# Altium schematic sheet Top-Sheet.SchDoc
size A4; SheetNumber: 1; SheetTotal: 11
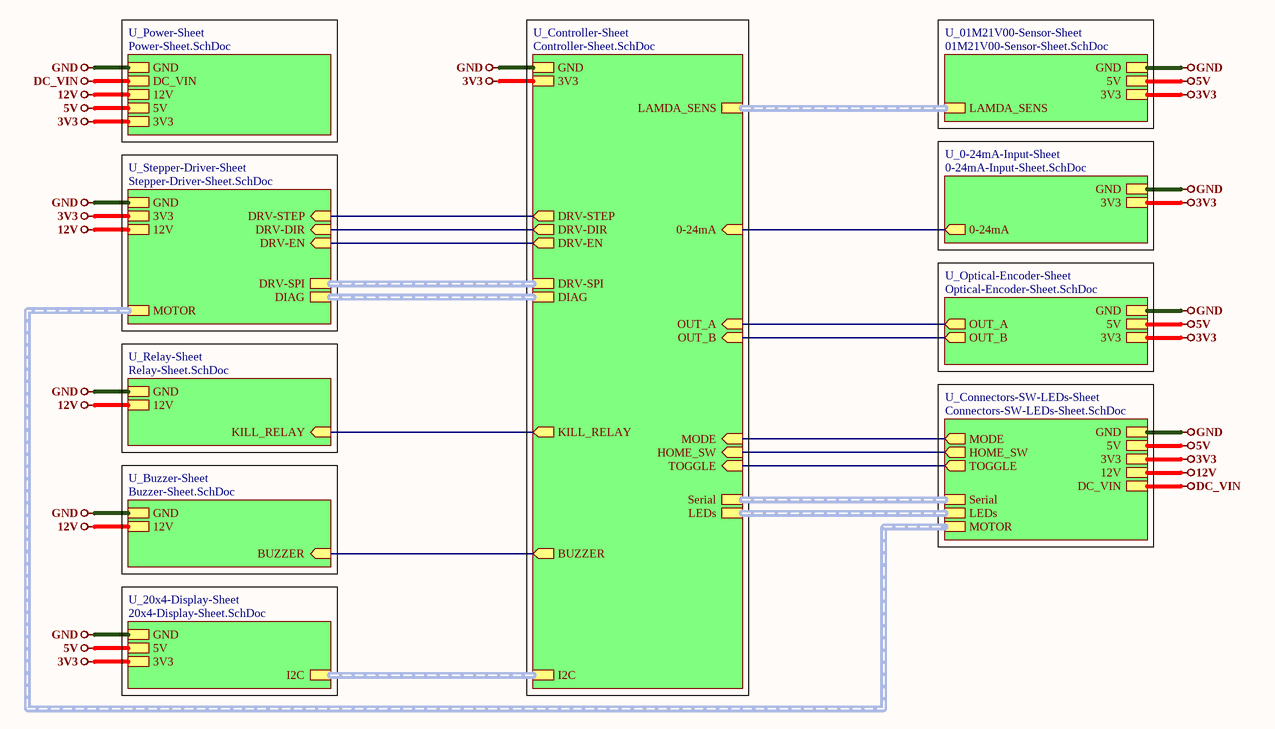
[diagram p0: Top-Sheet.SchDoc]

## Sub-sheets
U_0-24mA-Input-Sheet = 0-24mA-Input-Sheet.SchDoc: GND, 3V3, 0-24mA (out)
U_01M21V00-Sensor-Sheet = 01M21V00-Sensor-Sheet.SchDoc: GND, 5V, 3V3, LAMDA_SENS (harness LAMDA_SENS)
U_20x4-Display-Sheet = 20x4-Display-Sheet.SchDoc: GND, 5V, 3V3, I2C (harness I2C)
U_Buzzer-Sheet = Buzzer-Sheet.SchDoc: GND, 12V, BUZZER (in)
U_Connectors-SW-LEDs-Sheet = Connectors-SW-LEDs-Sheet.SchDoc: GND, 5V, 3V3, DC_VIN, Serial (harness Serial), MODE (out), HOME_SW (out), TOGGLE (out), MOTOR (harness MOTOR), 12V, LEDs (harness LEDs)
U_Controller-Sheet = Controller-Sheet.SchDoc: GND, 3V3, DRV-SPI (harness DRV-SPI), DIAG (harness DIAG), DRV-STEP (out), DRV-DIR (out), DRV-EN (out), KILL_RELAY (out), BUZZER (out), I2C (harness I2C), LAMDA_SENS (harness LAMDA_SENS), 0-24mA (in), OUT_A (in), OUT_B (in), Serial (harness Serial), MODE (in), HOME_SW (in), TOGGLE (in), LEDs (harness LEDs)
U_Optical-Encoder-Sheet = Optical-Encoder-Sheet.SchDoc: GND, 5V, 3V3, OUT_A (out), OUT_B (out)
U_Power-Sheet = Power-Sheet.SchDoc: GND, DC_VIN, 12V, 5V, 3V3
U_Relay-Sheet = Relay-Sheet.SchDoc: GND, 12V, KILL_RELAY (in)
U_Stepper-Driver-Sheet = Stepper-Driver-Sheet.SchDoc: GND, 3V3, 12V, MOTOR (harness MOTOR), DRV-SPI (harness DRV-SPI), DIAG (harness DIAG), DRV-STEP (in), DRV-DIR (in), DRV-EN (in)

## Nets
3V3: sheet U_Power-Sheet/3V3, sheet U_Controller-Sheet/3V3, sheet U_Stepper-Driver-Sheet/3V3, sheet U_20x4-Display-Sheet/3V3, sheet U_01M21V00-Sensor-Sheet/3V3, sheet U_0-24mA-Input-Sheet/3V3, sheet U_Optical-Encoder-Sheet/3V3, sheet U_Connectors-SW-LEDs-Sheet/3V3
5V: sheet U_Power-Sheet/5V, sheet U_20x4-Display-Sheet/5V, sheet U_01M21V00-Sensor-Sheet/5V, sheet U_Optical-Encoder-Sheet/5V, sheet U_Connectors-SW-LEDs-Sheet/5V
12V: sheet U_Power-Sheet/12V, sheet U_Stepper-Driver-Sheet/12V, sheet U_Relay-Sheet/12V, sheet U_Buzzer-Sheet/12V, sheet U_Connectors-SW-LEDs-Sheet/12V
DC_VIN: sheet U_Power-Sheet/DC_VIN, sheet U_Connectors-SW-LEDs-Sheet/DC_VIN
GND: sheet U_Power-Sheet/GND, sheet U_Controller-Sheet/GND, sheet U_Stepper-Driver-Sheet/GND, sheet U_Relay-Sheet/GND, sheet U_Buzzer-Sheet/GND, sheet U_20x4-Display-Sheet/GND, sheet U_01M21V00-Sensor-Sheet/GND, sheet U_0-24mA-Input-Sheet/GND, sheet U_Optical-Encoder-Sheet/GND, sheet U_Connectors-SW-LEDs-Sheet/GND
(unnamed): sheet U_Controller-Sheet/DRV-STEP, sheet U_Stepper-Driver-Sheet/DRV-STEP
(unnamed): sheet U_Controller-Sheet/DRV-DIR, sheet U_Stepper-Driver-Sheet/DRV-DIR
(unnamed): sheet U_Controller-Sheet/DRV-EN, sheet U_Stepper-Driver-Sheet/DRV-EN
(unnamed): sheet U_Controller-Sheet/KILL_RELAY, sheet U_Relay-Sheet/KILL_RELAY
(unnamed): sheet U_Controller-Sheet/BUZZER, sheet U_Buzzer-Sheet/BUZZER
(unnamed): sheet U_Controller-Sheet/0-24mA, sheet U_0-24mA-Input-Sheet/0-24mA
(unnamed): sheet U_Controller-Sheet/OUT_A, sheet U_Optical-Encoder-Sheet/OUT_A
(unnamed): sheet U_Controller-Sheet/OUT_B, sheet U_Optical-Encoder-Sheet/OUT_B
(unnamed): sheet U_Controller-Sheet/MODE, sheet U_Connectors-SW-LEDs-Sheet/MODE
(unnamed): sheet U_Controller-Sheet/HOME_SW, sheet U_Connectors-SW-LEDs-Sheet/HOME_SW
(unnamed): sheet U_Controller-Sheet/TOGGLE, sheet U_Connectors-SW-LEDs-Sheet/TOGGLE

## Buses and harness runs
harness sheet U_01M21V00-Sensor-Sheet/LAMDA_SENS = sheet U_Controller-Sheet/LAMDA_SENS
harness sheet U_20x4-Display-Sheet/I2C = sheet U_Controller-Sheet/I2C
harness sheet U_Connectors-SW-LEDs-Sheet/LEDs = sheet U_Controller-Sheet/LEDs
harness sheet U_Connectors-SW-LEDs-Sheet/MOTOR = sheet U_Stepper-Driver-Sheet/MOTOR
harness sheet U_Connectors-SW-LEDs-Sheet/Serial = sheet U_Controller-Sheet/Serial
harness sheet U_Controller-Sheet/DIAG = sheet U_Stepper-Driver-Sheet/DIAG
harness sheet U_Controller-Sheet/DRV-SPI = sheet U_Stepper-Driver-Sheet/DRV-SPI

## Notes on the sheet
- File:
- Title:
- Date:
- Page
- Num:
- Total:
- Drawn By: Huzaifa Ali